# Altium schematic sheet TIA.SchDoc
size A; SheetNumber: 2; SheetTotal: 8
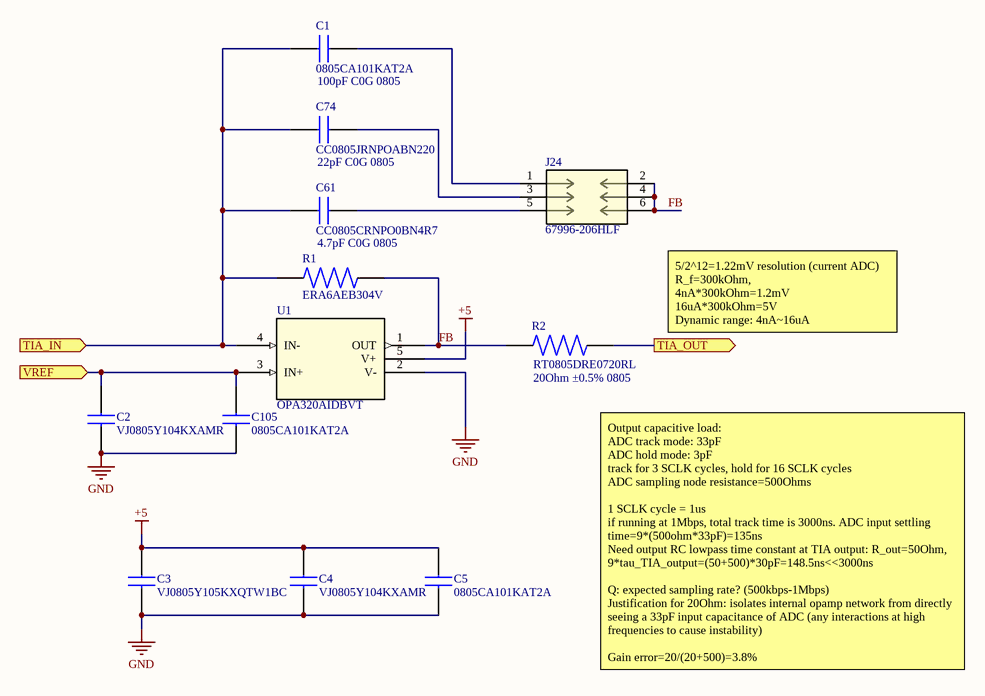
[diagram p0: TIA.SchDoc]

## Parts
C1  0805CA101KAT2A  [CAPC2112X94N]
C2  VJ0805Y104KXAMR  [CAPC2012X145N]
C3  VJ0805Y105KXQTW1BC  [CAPC2012X135N]
C4  VJ0805Y104KXAMR  [CAPC2012X145N]
C5  0805CA101KAT2A  [CAPC2112X94N]
C61  CC0805CRNPO0BN4R7  [CAP_CC0805_YAG]
C74  CC0805JRNPOABN220  [CAP_CC0805_YAG]
C105  0805CA101KAT2A  [CAPC2112X94N]
J24  67996-206HLF  [67996-206HLF_AMP]
R1  ERA6AEB304V  [RES_ERA6AEB304V]
R2  RT0805DRE0720RL  [RC0805N_YAG]
U1  OPA320AIDBVT  [DBV5]

## Ports
TIA_IN (in), TIA_OUT (out), VREF (in)

## Nets
+5: C3.2 C4.2 C5.2 U1.5(V+)
GND: C2.1 C3.1 C4.1 C5.1 C105.1 U1.2(V-)
FB: J24.2 J24.4 J24.6 R1.2 R2.1 U1.1(OUT)
TIA_IN: C1.1 C61.1 C74.1 R1.1 U1.4(IN-) ; port TIA_IN
TIA_OUT: R2.2 ; port TIA_OUT
VREF: C2.2 C105.2 U1.3(IN+) ; port VREF
NetC1_2: C1.2 J24.1
NetC61_2: C61.2 J24.5
NetC74_2: C74.2 J24.3

## Notes on the sheet
- 100pF C0G 0805
- 22pF C0G 0805
- 4.7pF C0G 0805
- 5/2^12=1.22mV resolution (current ADC)
  R_f=300kOhm,
  4nA*300kOhm=1.2mV
  16uA*300kOhm=5V
  Dynamic range: 4nA~16uA
- (near R2) 20Ohm ±0.5% 0805
- Output capacitive load:
  ADC track mode: 33pF
  ADC hold mode: 3pF
  track for 3 SCLK cycles, hold for 16 SCLK cycles
  ADC sampling node resistance=500Ohms
  1 SCLK cycle = 1us
  if running at 1Mbps, total track time is 3000ns. ADC input settling time=9*(500ohm*33pF)=135ns
  Need output RC lowpass time constant at TIA output: R_out=50Ohm, 9*tau_TIA_output=(50+500)*30pF=148.5ns<<3000ns
  Q: expected sampling rate? (500kbps-1Mbps)
  Justification for 20Ohm: isolates internal opamp network from directly seeing a 33pF input capacitance of ADC (any interactions at high frequencies to cause instability)
  Gain error=20/(20+500)=3.8%

## Library data of the parts
C1 C5 C105 = 0805CA101KAT2A: 100 pF +/-10% 1000V (1kV) Ceramic Capacitor C0G, NP0 0805 (2012 Metric); Manufacturer_Name: Kyocera AVX; Geometry.Height: 0.94mm; Mouser Part Number: 581-0805CA101KAT2A; Mouser Price/Stock: https://www.mouser.co.uk/ProductDetail/KYOCERA-AVX/0805CA101KAT2A?qs=ZBeOGGPQgEHtR%2FQeWT8jmQ%3D%3D; Manufacturer_Part_Number: 0805CA101KAT2A; Datasheet Link: https://datasheets.kyocera-avx.com/AVX-HV_MLCC.pdf
C2 C4 = VJ0805Y104KXAMR: Multilayer Ceramic Capacitors MLCC - SMD/SMT 0805 0.1uF 50volts X7R 10%; Manufacturer_Name: Vishay; Geometry.Height: 1.45mm; Mouser Part Number: 77-VJ0805Y104KXAMR; Mouser Price/Stock: https://www.mouser.co.uk/ProductDetail/Vishay-Vitramon/VJ0805Y104KXAMR?qs=iPOr8XgPdiSpDWrmTedxnA%3D%3D; Manufacturer_Part_Number: VJ0805Y104KXAMR; Datasheet Link: http://www.vishay.com/docs/45226/vj31xrohsautomlcc.pdf
C3 = VJ0805Y105KXQTW1BC: 1 µF ±10% 10V Ceramic Capacitor X7R 0805 (2012 Metric); Manufacturer_Name: Vishay; Geometry.Height: 1.35mm; Mouser Part Number: 77-VJ0805Y105KXQTBC; Mouser Price/Stock: https://www.mouser.co.uk/ProductDetail/Vishay-Vitramon/VJ0805Y105KXQTW1BC?qs=F2lBERbFaaHnNHh23%2Flzkg%3D%3D; Manufacturer_Part_Number: VJ0805Y105KXQTW1BC; Datasheet Link: https://www.vishay.com/docs/28548/vjw1bcbascomseries.pdf
C61 = CC0805CRNPO0BN4R7: 4.7 pF ±0.25pF 100V Ceramic Capacitor C0G, NP0 0805 (2012 Metric); Manufacturer_Name: Yageo; Copyright: Copyright (C) 2026 Ultra Librarian. All rights reserved.; Manufacturer_Part_Number: CC0805CRNPO0BN4R7
C74 = CC0805JRNPOABN220: 22 pF ±5% 200V Ceramic Capacitor C0G, NP0 0805 (2012 Metric); Manufacturer_Name: Yageo; Copyright: Copyright (C) 2026 Ultra Librarian. All rights reserved.; Manufacturer_Part_Number: CC0805JRNPOABN220
J24 = 67996-206HLF: Connector Header Through Hole 6 position 0.100" (2.54mm); Manufacturer_Name: Amphenol ICC; Copyright: Copyright (C) 2025 Ultra Librarian. All rights reserved.; Manufacturer_Part_Number: 67996-206HLF; RefDes: RefDes; Type: Type
R1 = ERA6AEB304V: RES SMD 300K OHM 0.1% 1/8W 0805; Availability: Unavailable; MP: ERA6AEB304V; Value: *; Price: None; Package: None; ComponentLink1Description: Digikey link; ComponentLink1URL: https://www.digikey.com/en/products/detail/panasonic-industry/ERA-6AEB304V/1465808
R2 = RT0805DRE0720RL: 20 Ohms ±0.5% 0.125W, 1/8W Chip Resistor 0805 (2012 Metric) Thin Film; Manufacturer_Name: Yageo; Copyright: Copyright (C) 2026 Ultra Librarian. All rights reserved.; Manufacturer_Part_Number: RT0805DRE0720RL
U1 = OPA320AIDBVT: Precision, zero-crossover, 20-MHz, 0.9-pA Ib, RRIO, CMOS operational amplifier 5-SOT-23 -40 to 125; Manufacturer_Name: Texas Instruments; Copyright: Copyright (C) 2025 Ultra Librarian. All rights reserved.; Manufacturer_Part_Number: OPA320AIDBVT; RefDes: RefDes; Type: Type